# EasyEDA Pro project board.epro, schematic 黄山派LCD屏幕板_SCH_V110
Board Name: LCD屏幕板; Create Date: 2025-02-19; Page Name: P1; Project Name: 立创·黄山派SF32LB52-MOD-1开发板; Schematic Name: 黄山派LCD屏幕板_SCH_V1.0; Update Date: 2025-03-05; Company: 嘉立创EDA; Page Size: A2; Version: V1.0
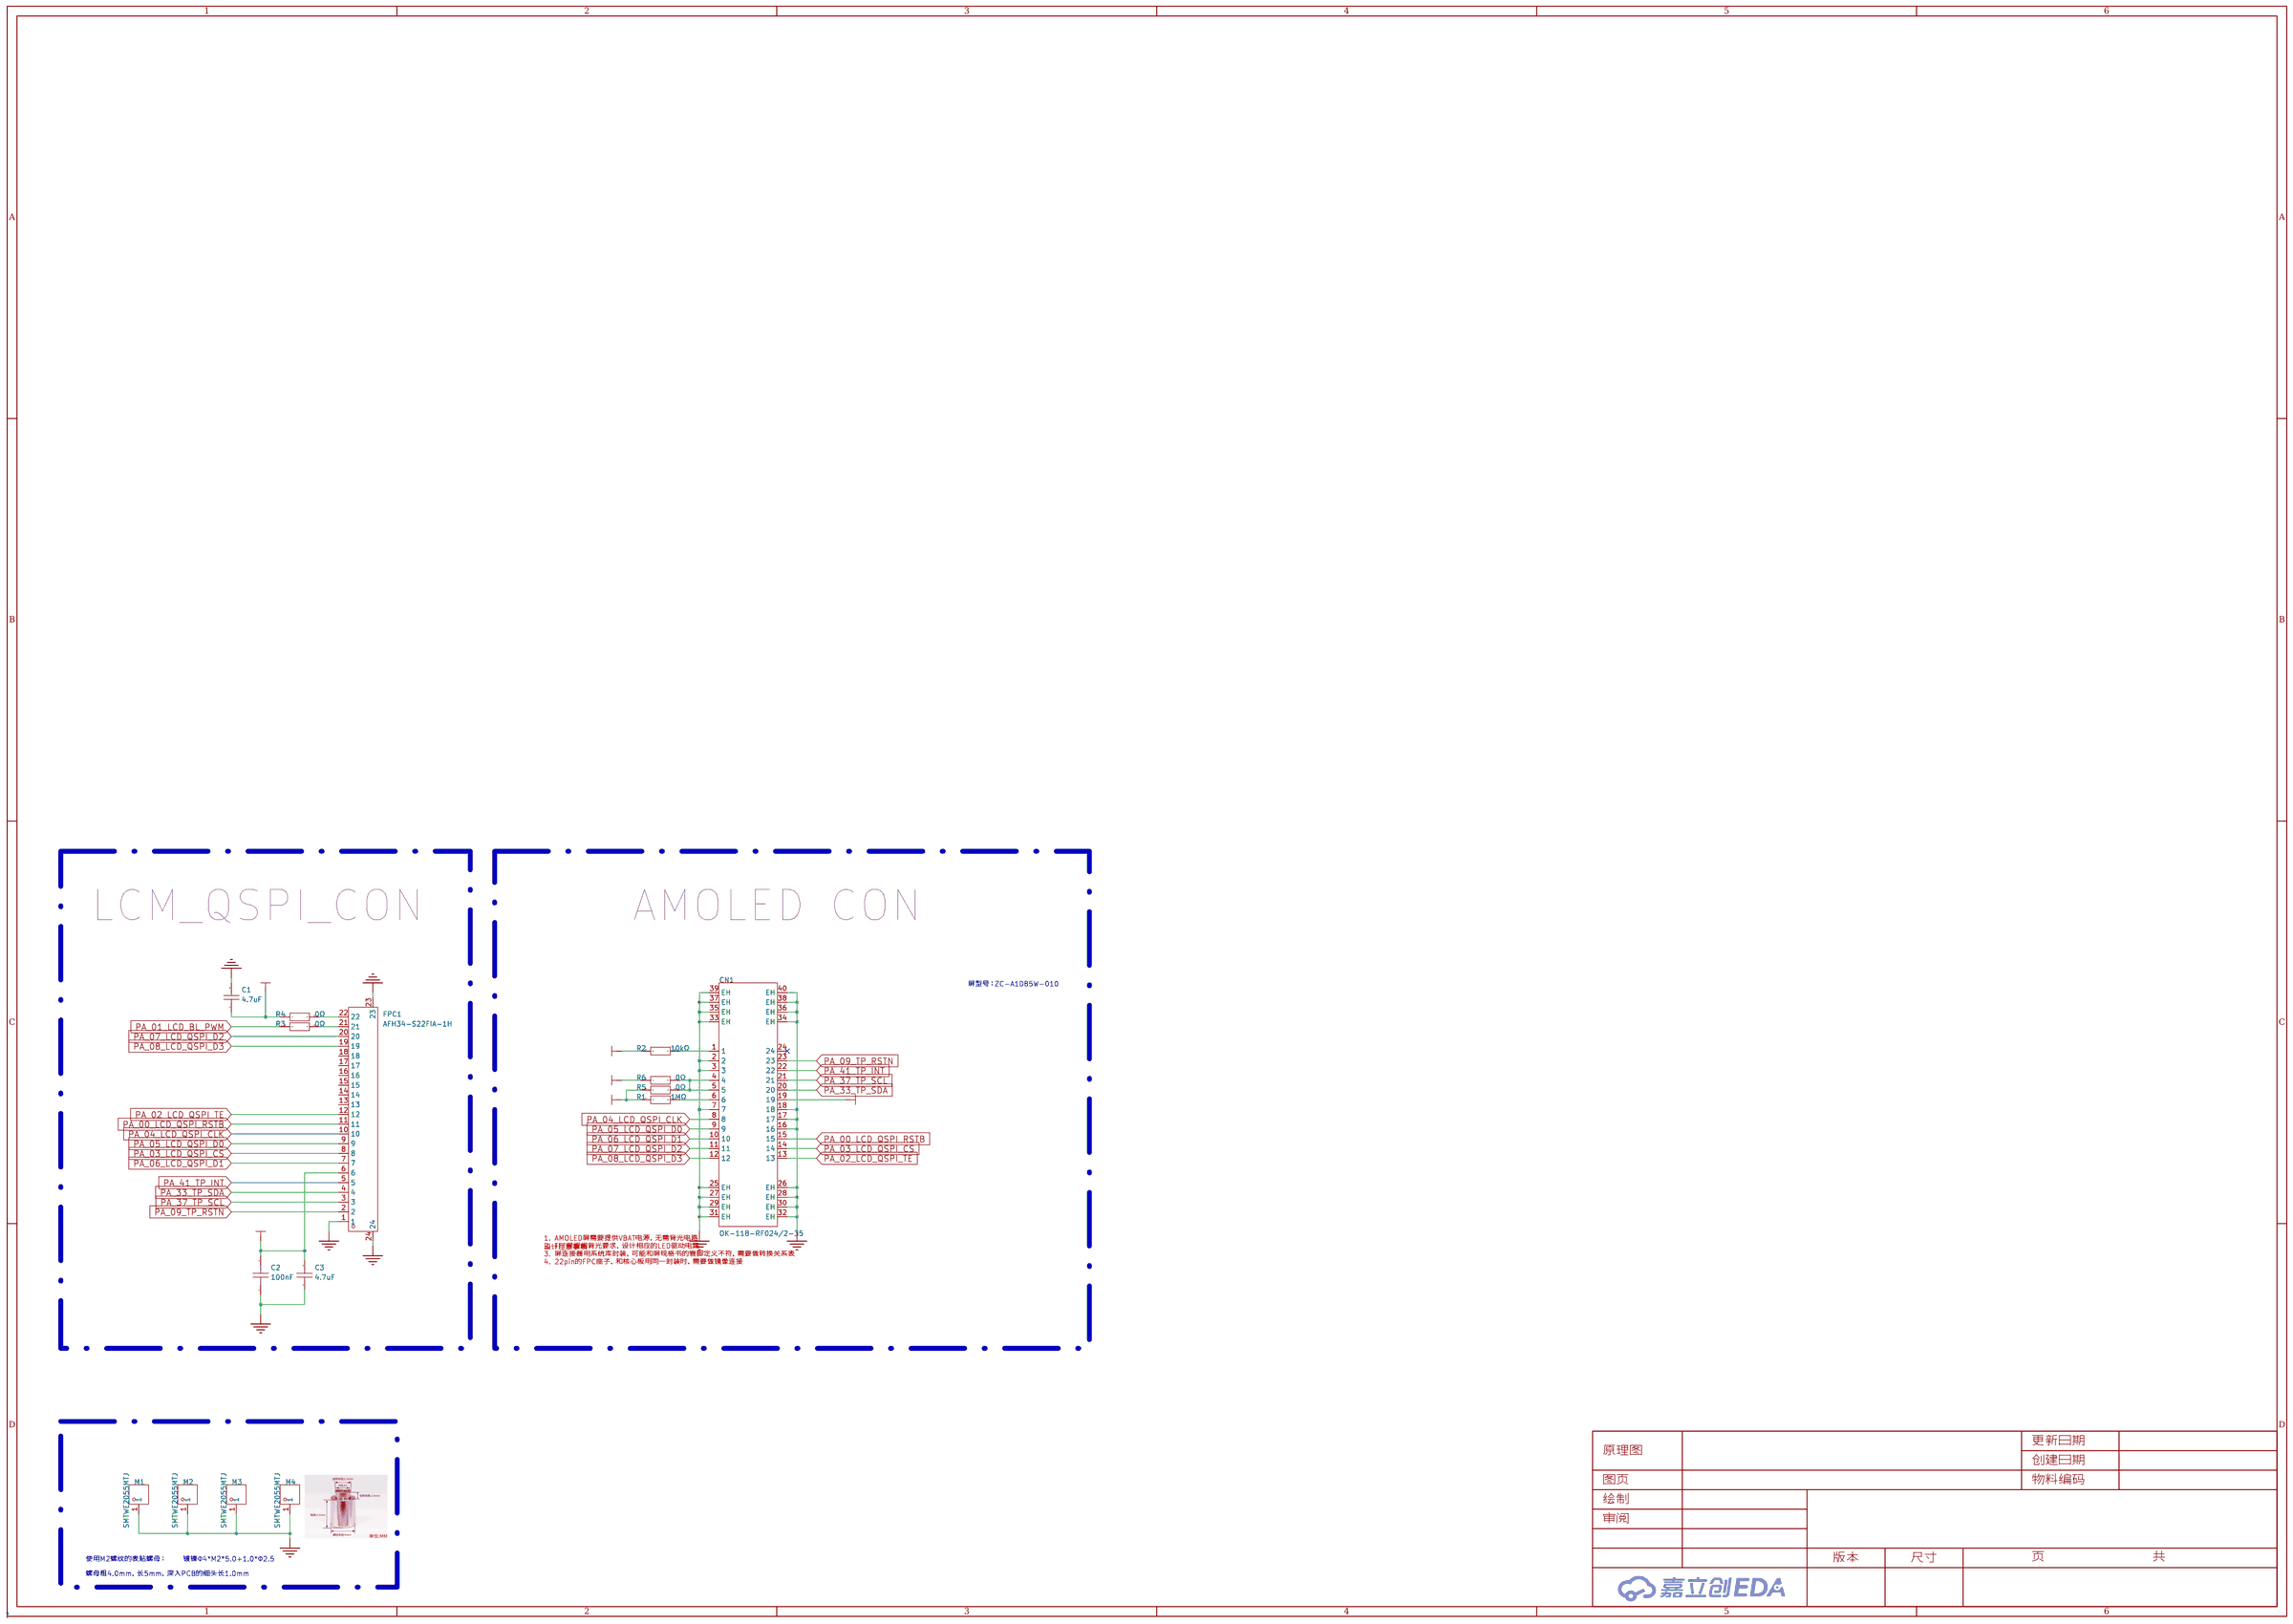
[diagram p0: schematic sheet]

## Parts
C1  4.7uF  [C0402]
C2  100nF  [R0402]
C3  4.7uF  [C0402]
CN1  OK-118-RF024/2-35  [CONN-SMD_24P-P0.35_OK-118-RF024-2-35]
FPC1  AFH34-S22FIA-1H  [FPC-SMD_22P-P0.50_JS_AFH34-S22FIA-1H]
M1  SMTWE2055MTJ  [SMD_BD4.4-L4.4-D2.8]
M2  SMTWE2055MTJ  [SMD_BD4.4-L4.4-D2.8]
M3  SMTWE2055MTJ  [SMD_BD4.4-L4.4-D2.8]
M4  SMTWE2055MTJ  [SMD_BD4.4-L4.4-D2.8]
R1  1MΩ  [R0402]
R2  10kΩ  [R0402]
R3  0Ω  [R0402]  (no BOM)
R4  0Ω  [R0402]
R5  0Ω  [R0402]  (no BOM)
R6  0Ω  [R0402]

## Library data of the parts
C1 C3 = CL05A475MP5NRNC: 容值:4.7uF;精度:±20%;额定电压:10V;材质(温度系数):X5R;; LCSC Part Name: 4.7uF ±20% 10V; Supplier Part: C23733; Manufacturer: SAMSUNG(三星); Supplier Footprint: 0402; JLCPCB Part Class: 基础库; Datasheet: https://atta.szlcsc.com/upload/public/pdf/source/20160218/1457707763339.pdf; Supplier: LCSC; Tolerance: ±20%; Voltage Rated: 10V; Temperature Coefficient: X5R
C2 = CL05B104KB54PNC: 容值:100nF;精度:±10%;额定电压:50V;材质(温度系数):X7R;; LCSC Part Name: 100nF ±10% 50V; Supplier Part: C307331; Manufacturer: SAMSUNG(三星); Supplier Footprint: 0402; JLCPCB Part Class: 基础库; Datasheet: https://atta.szlcsc.com/upload/public/pdf/source/20181009/C307331_222F7C870FD3EA5F46F538B483443886.pdf; Supplier: LCSC; Tolerance: ±10%; Voltage Rated: 50V; Temperature Coefficient: X7R
CN1 = OK-118-RF024/2-35: Supplier: LCSC; Supplier Part: C9900173937; Supplier Footprint: SMD
FPC1 = AFH34-S22FIA-1H: 锁定特性:翻盖式;触点类型:双侧触点/上下接;触点数量:22P;间距:0.5mm;安装类型:卧贴;; Supplier Part: C5139829; Manufacturer: JS(钜硕电子); Supplier Footprint: SMD,P=0.5mm; JLCPCB Part Class: 扩展库; Datasheet: https://atta.szlcsc.com/upload/public/pdf/source/20220815/7D7DE7AF64D38F9F159F8B104D5F304C.pdf; Supplier: LCSC; Locking Feature: 翻盖式; Contact Type: 双侧触点/上下接; Number of Contacts: 22P; Pitch: 0.5mm; Mounting Type: 卧贴; Height Above Board: 1mm; Contact Plating: 金
M1-M4 = SMTWE2055MTJ: M2x4.35xL5.5+1.4; LCSC Part Name: 雄和远景，电路板表贴圆螺母柱，M2X5.5，铁镀锡,1个; Supplier Part: C2928184; Manufacturer: Sinhoo(雄和远景); JLCPCB Part Class: 扩展库; Datasheet: https://atta.szlcsc.com/upload/public/pdf/source/20211216/3B98FC86D2861FAB61F136C7AD792648.pdf; Supplier: LCSC; surface treatment: 镀锡; Product Description: M2*4.35*5.5+1.4; brand: Sinhoo(雄和远景)
R1 = 0402WGF1004TCE: 电阻类型:厚膜电阻;阻值:1MΩ;精度:±1%;功率:62.5mW;; LCSC Part Name: 1MΩ ±1% 62.5mW; Supplier Part: C26083; Manufacturer: UNI-ROYAL(厚声); Supplier Footprint: 0402; JLCPCB Part Class: 基础库; Datasheet: https://atta.szlcsc.com/upload/public/pdf/source/20200306/C422600_1E6D84923E4A46A82E41ADD87F860B5C.pdf; Supplier: LCSC; Type: 厚膜电阻; Tolerance: ±1%; Power(Watts): 62.5mW; Temperature Coefficient: ±100ppm/℃; Overload Voltage (Max): 50V; Operating Temperature Range: -55℃~+155℃
R2 = 0402WGF1002TCE: 电阻类型:厚膜电阻;阻值:10kΩ;精度:±1%;功率:62.5mW;; LCSC Part Name: 10kΩ ±1% 62.5mW; Supplier Part: C25744; Manufacturer: UNI-ROYAL(厚声); Supplier Footprint: 0402; JLCPCB Part Class: 基础库; Datasheet: https://atta.szlcsc.com/upload/public/pdf/source/20200306/C422600_1E6D84923E4A46A82E41ADD87F860B5C.pdf; Supplier: LCSC; Type: 厚膜电阻; Tolerance: ±1%; Power(Watts): 62.5mW; Temperature Coefficient: ±100ppm/℃; Overload Voltage (Max): 50V; Operating Temperature Range: -55℃~+155℃
R3-R6 = 0402WGF0000TCE: 电阻类型:厚膜电阻;阻值:0Ω;精度:±1%;功率:62.5mW;; LCSC Part Name: 0Ω ±1% 62.5mW; Supplier Part: C17168; Manufacturer: UNI-ROYAL(厚声); Supplier Footprint: 0402; JLCPCB Part Class: 基础库; Datasheet: https://atta.szlcsc.com/upload/public/pdf/source/20200306/C422600_1E6D84923E4A46A82E41ADD87F860B5C.pdf; Supplier: LCSC; Type: 厚膜电阻; Tolerance: ±1%; Power(Watts): 62.5mW; Temperature Coefficient: ±800ppm/℃; Overload Voltage (Max): 50V; Operating Temperature Range: -55℃~+155℃

## Nets
GND: C1.2 C2.1 C3.1 CN1.2 CN1.3 CN1.7 CN1.16 CN1.17 CN1.18 CN1.25(EH) CN1.26(EH) CN1.27(EH) CN1.28(EH) CN1.29(EH) CN1.30(EH) CN1.31(EH) CN1.32(EH) CN1.33(EH) CN1.34(EH) CN1.35(EH) CN1.36(EH) CN1.37(EH) CN1.38(EH) CN1.39(EH) CN1.40(EH) FPC1.1 FPC1.23 FPC1.24 M1.1 M2.1 M3.1 M4.1
VBAT: C1.1 R4.1 R6.1
VCC_3V3: C2.2 C3.2 CN1.19 FPC1.6 R1.1 R2.1 R5.1
PA_00_LCD_QSPI_RSTB: CN1.15 FPC1.11
PA_01_LCD_BL_PWM: R3.1
PA_02_LCD_QSPI_TE: CN1.13 FPC1.12
PA_03_LCD_QSPI_CS: CN1.14 FPC1.8
PA_04_LCD_QSPI_CLK: CN1.8 FPC1.10
PA_05_LCD_QSPI_D0: CN1.9 FPC1.9
PA_06_LCD_QSPI_D1: CN1.10 FPC1.7
PA_07_LCD_QSPI_D2: CN1.11 FPC1.20
PA_08_LCD_QSPI_D3: CN1.12 FPC1.19
PA_09_TP_RSTN: CN1.23 FPC1.2
PA_33_TP_SDA: CN1.20 FPC1.4
PA_37_TP_SCL: CN1.21 FPC1.3
PA_41_TP_INT: CN1.22 FPC1.5
$1N6115: CN1.1 R2.2
$1N6940: CN1.6 R1.2
$1N7967: FPC1.21 R3.2
$1N8012: FPC1.22 R4.2
$1N8098: CN1.4 CN1.5 R5.2 R6.2

Not connected (* = marked no-connect by the designer): CN1 24*; FPC1 13 14 15 16 17 18

## Notes on the sheet
- LCM_QSPI_CON
- AMOLED CON
- 屏型号：ZC-A1D85W-010
- 设计注意事项：
- 1. AMOLED屏需要提供VBAT电源，无需背光电路
  2. TFT屏根据背光要求，设计相应的LED驱动电路
  3. 屏连接器用系统库封装，可能和屏规格书的管脚定义不符，需要做转换关系表
  4. 22pin的FPC座子，和核心板用同一封装时，需要做镜像连接
- 使用M2螺纹的表贴螺母：
- 镀镍Φ4*M2*5.0+1.0*Φ2.5
- 螺母粗4.0mm，长5mm，深入PCB的细头长1.0mm
